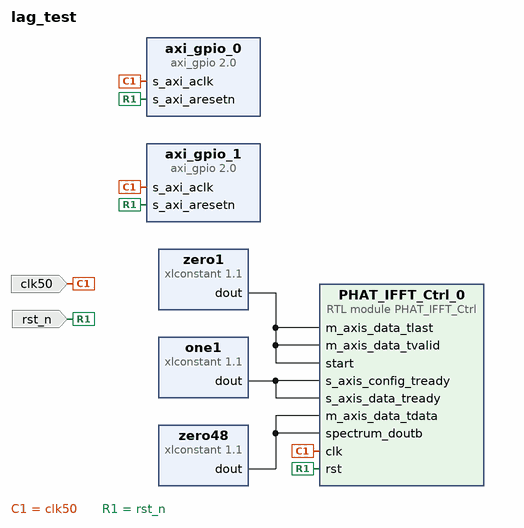
[diagram p0: block diagram of the top level]
# Vivado block design lag_test, xc7z020clg400-1, Vivado 2018.3
create_bd_design lag_test

create_bd_port -dir I -type clk clk50
set_property -dict {CONFIG.FREQ_HZ 50000000} [get_bd_ports clk50]
create_bd_port -dir I -type rst rst_n
set_property -dict {CONFIG.POLARITY ACTIVE_LOW} [get_bd_ports rst_n]

create_bd_cell -type module -reference PHAT_IFFT_Ctrl PHAT_IFFT_Ctrl_0
create_bd_cell -type ip -vlnv xilinx.com:ip:axi_gpio:2.0 axi_gpio_0
create_bd_cell -type ip -vlnv xilinx.com:ip:axi_gpio:2.0 axi_gpio_1
create_bd_cell -type ip -vlnv xilinx.com:ip:xlconstant:1.1 zero1
set_property -dict {CONFIG.CONST_VAL 0 CONFIG.CONST_WIDTH 1} [get_bd_cells zero1]
create_bd_cell -type ip -vlnv xilinx.com:ip:xlconstant:1.1 one1
set_property -dict {CONFIG.CONST_VAL 1 CONFIG.CONST_WIDTH 1} [get_bd_cells one1]
create_bd_cell -type ip -vlnv xilinx.com:ip:xlconstant:1.1 zero48
set_property -dict {CONFIG.CONST_VAL 0 CONFIG.CONST_WIDTH 48} [get_bd_cells zero48]

# ---- connections ----

connect_bd_net -net clk50_1 [get_bd_ports clk50] \
  [get_bd_pins PHAT_IFFT_Ctrl_0/clk] [get_bd_pins axi_gpio_0/s_axi_aclk] [get_bd_pins axi_gpio_1/s_axi_aclk]
connect_bd_net [get_bd_ports rst_n] [get_bd_pins PHAT_IFFT_Ctrl_0/rst] [get_bd_pins axi_gpio_0/s_axi_aresetn] [get_bd_pins axi_gpio_1/s_axi_aresetn]
connect_bd_net [get_bd_pins zero1/dout] \
  [get_bd_pins PHAT_IFFT_Ctrl_0/start] [get_bd_pins PHAT_IFFT_Ctrl_0/m_axis_data_tvalid] \
  [get_bd_pins PHAT_IFFT_Ctrl_0/m_axis_data_tlast]
connect_bd_net [get_bd_pins one1/dout] [get_bd_pins PHAT_IFFT_Ctrl_0/s_axis_config_tready] [get_bd_pins PHAT_IFFT_Ctrl_0/s_axis_data_tready]
connect_bd_net [get_bd_pins zero48/dout] [get_bd_pins PHAT_IFFT_Ctrl_0/spectrum_doutb] [get_bd_pins PHAT_IFFT_Ctrl_0/m_axis_data_tdata]

validate_bd_design
save_bd_design
